# Altium schematic sheet CURRENT_MEASURE.SchDoc
size A4; SheetNumber: 4; SheetTotal: 9
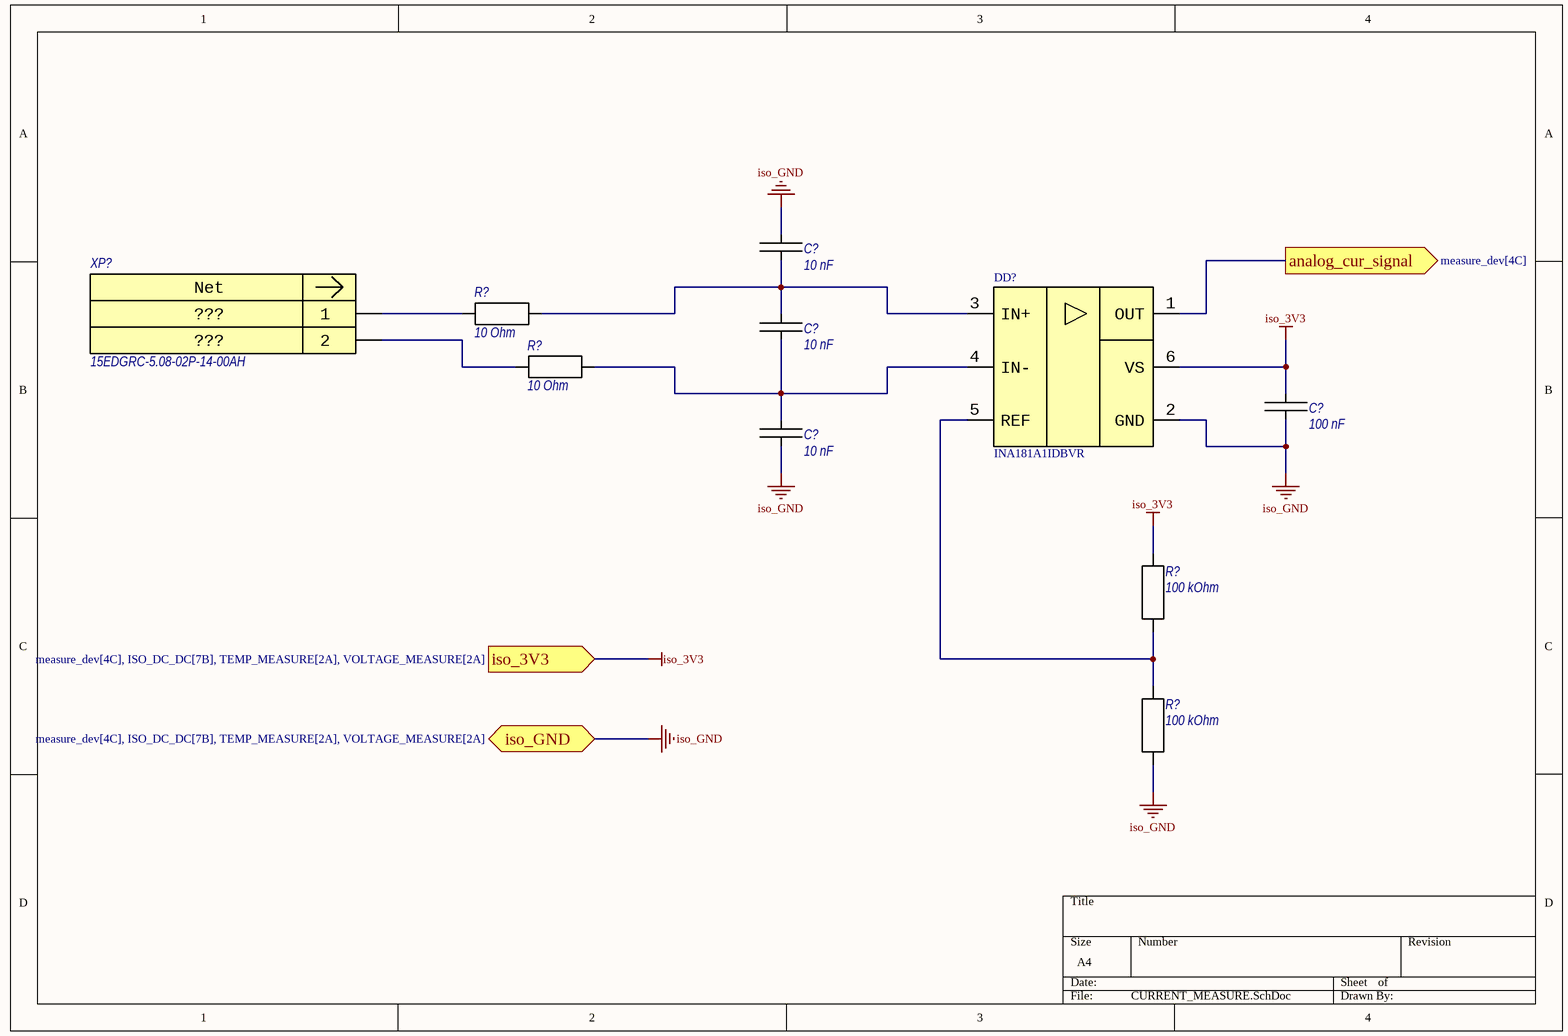
[diagram p0: CURRENT_MEASURE.SchDoc]

## Parts
(Parts that share a designator on the sheet are numbered #1, #2 ... from top to bottom, then left to right.)
C?#1  10 nF  [0603C]
C?#2  10 nF  [0603C]
C?#3  100 nF  [0603C]
C?#4  10 nF  [0603C]
DD?  INA181A1IDBVR  [SOT-23-6]
R?#1  10 Ohm  [0603R]
R?#2  10 Ohm  [0603R]
R?#3  100 kOhm  [0603R]
R?#4  100 kOhm  [0603R]
XP?  15EDGRC-5.08-02P-14-00AH  [15EDGRC-5.08-02P]

## Ports
analog_cur_signal (out, see measure_dev[4C]), iso_3V3 (in, see measure_dev[4C], ISO_DC_DC[7B], TEMP_MEASURE[2A], VOLTAGE_MEASURE[2A]), iso_GND (bidir, see measure_dev[4C], ISO_DC_DC[7B], TEMP_MEASURE[2A], VOLTAGE_MEASURE[2A])

## Nets
iso_3V3: C?#3.1 DD?.6(VS) R?#3.1 ; port iso_3V3
iso_GND: C?#1.1 C?#3.2 C?#4.2 DD?.2(GND) R?#4.2 ; port iso_GND
analog_cur_signal: DD?.1(OUT) ; port analog_cur_signal
NetC?#1_2: C?#1.2 C?#2.1 DD?.3(IN+) R?#1.2
NetC?#2_2: C?#2.2 C?#4.1 DD?.4(IN-) R?#2.2
NetDD?_5: DD?.5(REF) R?#3.2 R?#4.1
NetR?#1_1: R?#1.1 XP?.1
NetR?#2_1: R?#2.1 XP?.2

## Notes on the sheet
- (in symbol 15EDGRC-5.08-02P-14-00AH) Net

## Library data of the parts
C?#1 C?#2 C?#4 = CL10B103KB8NNN: Manufacturer: Samsung; Tolerance: 10%; Voltage: 50 V; Dielectric: X7R; Part Number: CL10B103KB8NNN; Package: 0603; Value: 10 nF
C?#3 = CL10B104KB8NNN: Manufacturer: Samsung; Tolerance: 10%; Voltage: 50 V; Dielectric: X7R; Part Number: CL10B104KB8NNN; Package: 0603; Value: 100 nF
DD? = INA181A1IDBVR: -; Manufacturer: TI; Part Number: INA181A1IDBVR; Package: SOT-23-6; Type: Current-Sense bi-directional Amplifier; Datasheet: https://static.chipdip.ru/lib/442/DOC049442855.pdf
R?#1 R?#2 = RC0603FR-0710RL: Manufacturer: Yageo; Tolerance: 1%; Power: 0.100 Watt; Part Number: RC0603FR-0710RL; Package: 0603; Value: 10 Ohm
R?#3 R?#4 = RC0603FR-07100KL: Manufacturer: Yageo; Tolerance: 1%; Power: 0.100 Watt; Part Number: RC0603FR-07100KL; Package: 0603; Value: 100 kOhm
XP? = 15EDGRC-5.08-02P-14-00AH: Manufacturer: DEGSON; Imax: 7 A; Umax: 450 V; Mating Connector: 15EDGK-5.08-02P-14; pin1: ???; Part Number: 15EDGRC-5.08-02P-14-00AH; Datasheet: https://cdn.promelec.ru/upload/items/2020/05/15/15EDGRC-5.08.pdf; pin2: ???; pin3: ???; pin4: ???; pin5: ???; pin6: ???; pin7: ???; pin8: ???; pin9: ???; pin10: ???; pin11: ???; pin12: ???; pin13: ???; pin14: ???; pin15: ???; pin16: ???; pin17: ???; pin18: ???; pin19: ???; pin20: ???; pin21: ???; pin22: ???; pin23: ???; pin24: ???; pin25: ???; pin26: ???; pin27: ???; pin28: ???; pin29: ???; pin30: ???; pin31: ???; pin32: ???; pin33: ???; pin34: ???; pin35: ???; pin36: ???; pin37: ???; pin38: ???; pin39: ???; pin40: ???; pin41: ???; pin42: ???; pin43: ???; pin44: ???; pin45: ???; pin46: ???; pin47: ???; pin48: ???; pin49: ???; pin50: ???